# Altium schematic sheet RK3566_VO_SHEET_1.SchDoc
size A4; SheetNumber: 15; SheetTotal: 23
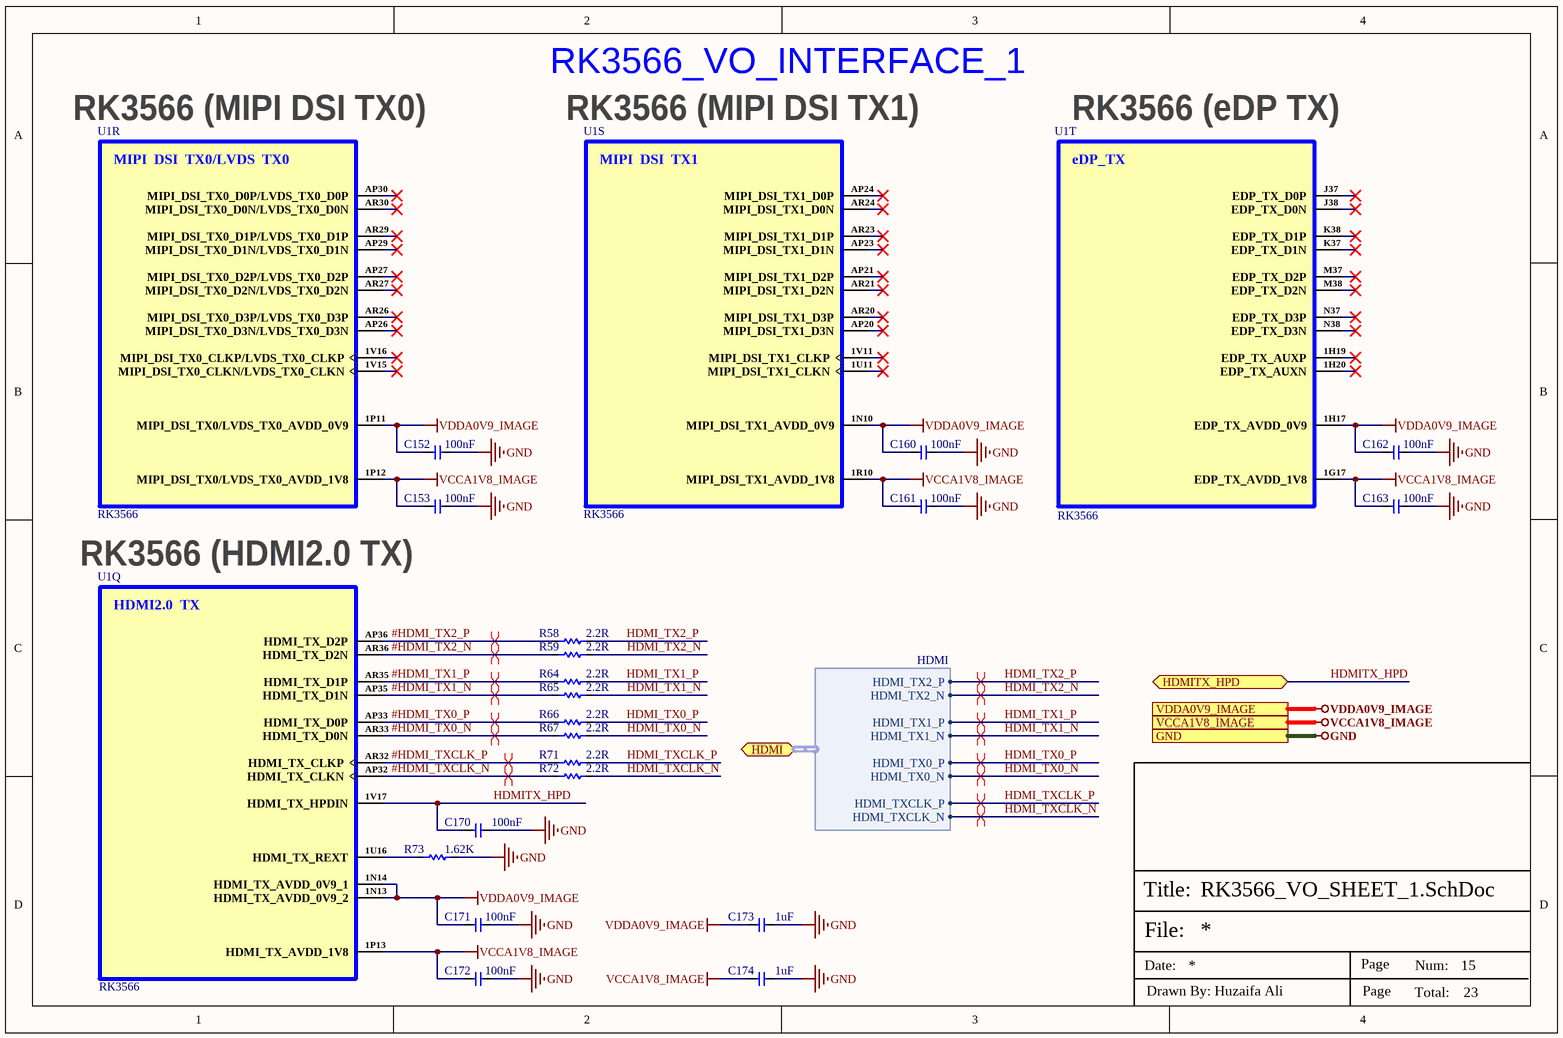
[diagram p0: RK3566_VO_SHEET_1.SchDoc]

## Parts
C152  100nF  [CAP-0201]
C153  100nF  [CAP-0201]
C160  100nF  [CAP-0201]
C161  100nF  [CAP-0201]
C162  100nF  [CAP-0201]
C163  100nF  [CAP-0201]
C170  100nF  [CAP-0201]
C171  100nF  [CAP-0201]
C172  100nF  [CAP-0201]
C173  1uF  [Cap-0402]
C174  1uF  [CAP-0201]
R58  2.2R  [Res-0201]
R59  2.2R  [Res-0201]
R64  2.2R  [Res-0201]
R65  2.2R  [Res-0201]
R66  2.2R  [Res-0201]
R67  2.2R  [Res-0201]
R71  2.2R  [Res-0201]
R72  2.2R  [Res-0201]
R73  1.62K  [Res-0201]
U1  RK3566  [BGA-565(15.5x14.4)]  (parts Q,R,S,T of 22)

## Ports
GND (see DRAM_LPDDR4_SHEET[6D], eMMC_SPI-FLASH_SHEET[1D], HDMI2.0_SHEET[3D], POWER_LDO_SHEET[3D], POWER_OTHER_SHEET[3C], POWER_PMIC_RK809_CODEC[3C], POWER_PMIC_RK809_DC DC[3D], POWER_PMIC_RK809_LDO[4C], POWER_PMIC_RK809_MGM[3D], RK3566_AUDIO_SHEET[3C], RK3566_DDR-PHY_SHEET[5D], RK3566_FLASH-SD_SHEET[4C], RK3566_OSC_PMUIO_SHEET[5D], RK3566_POWER_SHEET[3D], RK3566_SARADC_GPIO[3D], RK3566_USB_PCIe_SHEET[3D], RK3566_VI_SHEET[3D], RK3566_VO_SHEET_2[4C], TYPE-C_INTERFACE_SHEET[3D], TYPE-C_TO_MIPI-CSI_SHEET[5D], USB2.0_SHEET[3D], WIFI-6_SHEET[3D]), HDMI (bidir, harness HDMI, see HDMI2.0_SHEET[2D]), HDMITX_HPD (bidir, see HDMI2.0_SHEET[3D]), VCCA1V8_IMAGE (see POWER_PMIC_RK809_LDO[4C], RK3566_VI_SHEET[3D]), VDDA0V9_IMAGE (see POWER_PMIC_RK809_LDO[4C], RK3566_VI_SHEET[3D])

## Harnesses
HDMI: HDMI_TX2_P, HDMI_TX2_N, HDMI_TX1_P, HDMI_TX1_N, HDMI_TX0_P, HDMI_TX0_N, HDMI_TXCLK_P, HDMI_TXCLK_N

## Nets
GND: C152.1 C153.1 C160.1 C161.1 C162.1 C163.1 C170.1 C171.1 C172.1 C173.1 C174.1 R73.2 ; port GND
VCCA1V8_IMAGE: C153.2 C161.2 C163.2 C172.2 C174.2 U1.1G17(EDP_TX_AVDD_1V8) U1.1P12(MIPI_DSI_TX0/LVDS_TX0_AVDD_1V8) U1.1P13(HDMI_TX_AVDD_1V8) U1.1R10(MIPI_DSI_TX1_AVDD_1V8) ; port VCCA1V8_IMAGE
VDDA0V9_IMAGE: C152.2 C160.2 C162.2 C171.2 C173.2 U1.1H17(EDP_TX_AVDD_0V9) U1.1N10(MIPI_DSI_TX1_AVDD_0V9) U1.1N13(HDMI_TX_AVDD_0V9_2) U1.1N14(HDMI_TX_AVDD_0V9_1) U1.1P11(MIPI_DSI_TX0/LVDS_TX0_AVDD_0V9) ; port VDDA0V9_IMAGE
#HDMI_TX0_N: R67.1 U1.AR33(HDMI_TX_D0N)
#HDMI_TX0_P: R66.1 U1.AP33(HDMI_TX_D0P)
#HDMI_TX1_N: R65.1 U1.AP35(HDMI_TX_D1N)
#HDMI_TX1_P: R64.1 U1.AR35(HDMI_TX_D1P)
#HDMI_TX2_N: R59.1 U1.AR36(HDMI_TX_D2N)
#HDMI_TX2_P: R58.1 U1.AP36(HDMI_TX_D2P)
#HDMI_TXCLK_N: R72.1 U1.AP32(HDMI_TX_CLKN)
#HDMI_TXCLK_P: R71.1 U1.AR32(HDMI_TX_CLKP)
HDMI_TX0_N: R67.2 ; port HDMI.HDMI_TX0_N
HDMI_TX0_P: R66.2 ; port HDMI.HDMI_TX0_P
HDMI_TX1_N: R65.2 ; port HDMI.HDMI_TX1_N
HDMI_TX1_P: R64.2 ; port HDMI.HDMI_TX1_P
HDMI_TX2_N: R59.2 ; port HDMI.HDMI_TX2_N
HDMI_TX2_P: R58.2 ; port HDMI.HDMI_TX2_P
HDMI_TXCLK_N: R72.2 ; port HDMI.HDMI_TXCLK_N
HDMI_TXCLK_P: R71.2 ; port HDMI.HDMI_TXCLK_P
HDMITX_HPD: C170.2 U1.1V17(HDMI_TX_HPDIN) ; port HDMITX_HPD
NetR73_1: R73.1 U1.1U16(HDMI_TX_REXT)

Not connected (* = marked no-connect by the designer): U1 1H19(EDP_TX_AUXP)* 1H20(EDP_TX_AUXN)* 1U11(MIPI_DSI_TX1_CLKN)* 1V11(MIPI_DSI_TX1_CLKP)* 1V15(MIPI_DSI_TX0_CLKN/LVDS_TX0_CLKN)* 1V16(MIPI_DSI_TX0_CLKP/LVDS_TX0_CLKP)* AP20(MIPI_DSI_TX1_D3N)* AP21(MIPI_DSI_TX1_D2P)* AP23(MIPI_DSI_TX1_D1N)* AP24(MIPI_DSI_TX1_D0P)* AP26(MIPI_DSI_TX0_D3N/LVDS_TX0_D3N)* AP27(MIPI_DSI_TX0_D2P/LVDS_TX0_D2P)* AP29(MIPI_DSI_TX0_D1N/LVDS_TX0_D1N)* AP30(MIPI_DSI_TX0_D0P/LVDS_TX0_D0P)* AR20(MIPI_DSI_TX1_D3P)* AR21(MIPI_DSI_TX1_D2N)* AR23(MIPI_DSI_TX1_D1P)* AR24(MIPI_DSI_TX1_D0N)* AR26(MIPI_DSI_TX0_D3P/LVDS_TX0_D3P)* AR27(MIPI_DSI_TX0_D2N/LVDS_TX0_D2N)* AR29(MIPI_DSI_TX0_D1P/LVDS_TX0_D1P)* AR30(MIPI_DSI_TX0_D0N/LVDS_TX0_D0N)* J37(EDP_TX_D0P)* J38(EDP_TX_D0N)* K37(EDP_TX_D1N)* K38(EDP_TX_D1P)* M37(EDP_TX_D2P)* M38(EDP_TX_D2N)* N37(EDP_TX_D3P)* N38(EDP_TX_D3N)*

## Layout directives
differential pair; differential pair class HDMI_100R: #HDMI_TX0_N, #HDMI_TX0_P, #HDMI_TX1_N, #HDMI_TX1_P, #HDMI_TX2_N, #HDMI_TX2_P, #HDMI_TXCLK_N, #HDMI_TXCLK_P, HDMI_TX0_N, HDMI_TX0_P, HDMI_TX1_N, HDMI_TX1_P, HDMI_TX2_N, HDMI_TX2_P, HDMI_TXCLK_N, HDMI_TXCLK_P

## Notes on the sheet
- RK3566 (MIPI DSI TX0)
- RK3566 (MIPI DSI TX1)
- RK3566_VO_INTERFACE_1
- RK3566 (eDP TX)
- (near C153) RK3566 (HDMI2.0 TX)
- File:
- Title:
- Date:
- Page
- Num:
- Total:
- Drawn By: Huzaifa Ali
- (in symbol RK3566, part Q) HDMI2.0  TX
- (in symbol RK3566, part R) MIPI  DSI  TX0/LVDS  TX0
- (in symbol RK3566, part S) MIPI  DSI  TX1
- (in symbol RK3566, part T) eDP_TX

## Library data of the parts
C152 C153 C160-C163 C170-C172 = CC0201KRX5R6BB104: CAP CER 0.1UF 10V X5R 0201; Manufacturer: Yageo; Tolerance: 10%; Supplier 1: Mouser; Manufacturer Part Number: CC0201KRX5R6BB104; RoHS: Yes; Category: Ceramic Capacitors; Stock 1: 824403; Pricing 1: 1=0.10000, 10=0.02400, 50=0.02400, 100=0.01900, 1000=0.01100, 10000=0.00900 (USD); Mount: Surface Mount; Case/Package: 0201; Case Code (Imperial): 0201; Case Code (Metric): 0603; Weight: 6E-06oz; Min Operating Temperature: -55°C; Max Operating Temperature: 85°C; Capacitance: 100nF; Dielectric: X5R; Voltage Rating (DC): 10V; Packaging: Tape and Reel; Termination: SMD/SMT; Resistor Type: Ceramic; Voltage Rating: 10V; Series: CC; Construction: Flat; Length: 0.6mm; Width: 0.012inch; Height: 0.3mm; Thickness: 0.013inch; Depth: 0.3mm; Radiation Hardening: No; Lead Free: Lead Free; Halogen Free: Halogen Free; RoHS Compliant: Yes; ComponentLink1URL: https://datasheet.ciiva.com/11587/upy-gphc-x5r-4v-to-50v-12-11587190.pdf?src-supplier=Avnet; ComponentLink1Description: https://datasheet.ciiva.com/11587/upy-gphc-x5r-4v-to-50v-12-11587190.pdf?src-supplier=Avnet; Supplier Part Number 1: 603-CC201KRX5R6BB104; LCSC Part Number: C190183
C173 = CC0402KRX5R6BB105: CAP CER 1UF 10V X5R 0402; Manufacturer: Yageo; Item Type: Capacitor; Tolerance: 10%; Dissipation Factor: 15%; Manufacturer Part Number: CC0402KRX5R6BB105; RoHS: Yes; Category: Ceramic Capacitors; ComponentLink1URL: https://datasheet.ciiva.com/176/upy-gphc-x5r-4v-to-50v-12-176704.pdf?src-supplier=Digi-Key; ComponentLink1Description: https://datasheet.ciiva.com/176/upy-gphc-x5r-4v-to-50v-12-176704.pdf?src-supplier=Digi-Key; ComponentLink2URL: https://datasheet.ciiva.com/176/mlccorderingcode-176705.pdf?src-supplier=Digi-Key; ComponentLink2Description: https://datasheet.ciiva.com/176/mlccorderingcode-176705.pdf?src-supplier=Digi-Key; LCSC Part Number: C106254; ComponentLink3URL: https://datasheet.ciiva.com/176/mlccorderingcode-176706.pdf?src-supplier=Digi-Key; ComponentLink3Description: https://datasheet.ciiva.com/176/mlccorderingcode-176706.pdf?src-supplier=Digi-Key; Supplier 1: Mouser; Stock 1: 6711367; Pricing 1: 1=0.11000, 10=0.05500, 50=0.05500, 100=0.03300, 500=0.02700, 1000=0.02200, 2500=0.02100, 10000=0.01800 (USD); Mount: Surface Mount; Case/Package: 0402; Number of Pins: 2; Case Code (Metric): 1005; Case Code (Imperial): 0402; Min Operating Temperature: -55°C; Max Operating Temperature: 85°C; Capacitance: 1uF; Dielectric: X5R; Package Quantity: 1; Voltage Rating: 10V; Packaging: Tape and Reel; Voltage Rating (DC): 10V; Termination: SMD/SMT; Resistor Type: Ceramic; Series: CC; Construction: Flat; Length: 1mm; Width: 0.02inch; Height: 0.5mm; Thickness: 0.022inch; Depth: 0.5mm; Radiation Hardening: No; REACH SVHC: No SVHC; Lead Free: Lead Free; Halogen Free: Halogen Free; RoHS Compliant: Yes; Supplier Part Number 1: 603-CC402KRX5R6BB105
C174 = CC0201MRX5R6BB105: CAP CER 1UF 10V X5R 0201; Manufacturer: Yageo; Item Type: Capacitor; Manufacturer Part Number: CC0201MRX5R6BB105; RoHS: Yes; Category: Ceramic Capacitors; ComponentLink1URL: https://datasheet.octopart.com/CC0201MRX5R6BB105-Yageo-datasheet-158238148.pdf?src-supplier=Farnell; ComponentLink1Description: https://datasheet.octopart.com/CC0201MRX5R6BB105-Yageo-datasheet-158238148.pdf?src-supplier=Farnell; ComponentLink2URL: http://www.yageo.com/documents/recent/UPY-GPHC_X5R_4V-to-50V_25.pdf?src-supplier=Digi-Key; ComponentLink2Description: http://www.yageo.com/documents/recent/UPY-GPHC_X5R_4V-to-50V_25.pdf?src-supplier=Digi-Key; LCSC Part Number: C605210; Supplier: Digi-Key; Supplier Part Number: 311-3474-1-ND; Stock: 772400; Pricing: 1=0.19, 10=0.135, 50=0.0764, 100=0.0633, 500=0.04436, 1000=0.03672, 2500=0.03418, 5000=0.03127 (USD); ComponentLink3URL: https://datasheet.octopart.com/CC0201MRX5R6BB105-Yageo-datasheet-137700082.pdf?src-supplier=Future+Electronics; ComponentLink3Description: https://datasheet.octopart.com/CC0201MRX5R6BB105-Yageo-datasheet-137700082.pdf?src-supplier=Future+Electronics
R58 R59 R64-R67 R71 R72 = 0201WMF220KTEE: 50mW Thick Film Resistors 25V ±1% -100ppm/℃~+350ppm/℃ 2.2Ω 0201 Chip Resistor - Surface Mount ROHS; Manufacturer: UNI-ROYAL; Manufacturer Part Number: 0201WMF220KTEE; ComponentLink1URL: https://www.lcsc.com/product-detail/Chip-Resistor-Surface-Mount_UNI-ROYAL-Uniroyal-Elec-0201WMF220KTEE_C473517.html; ComponentLink1Description: LCSC; LCSC Part Number: C473517; Package: 0201; Item Type: Resistor
R73 = RC0201DR-071K62L: RES 1.62K OHM 0.5% 1/20W 0201; Manufacturer: Yageo; Value: 1.62kR; Max Power Dissipation: 50mW; Temperature Coefficient: 200ppm/°C; Item Type: Resistor; Supplier: Avnet; Supplier Part Number: RC0201DR-071K62L; Manufacturer Part Number: RC0201DR-071K62L; RoHS: Yes; Category: Chip SMD Resistors; Pricing: 10000=0.01131 (USD); Case/Package: 0201; Min Operating Temperature: -55°C; Max Operating Temperature: 125°C; Packaging: Tape and Reel; Number of Terminations: 2; Tolerance: 0.5%; Features: Moisture Resistant; Series: RC; Length: 0.024inch; Width: 0.012inch; Height: 0.01inch; RoHS Compliant: Yes; ComponentLink1URL: http://www.yageo.com.tw/exep/pages/download/literatures/PYu-R_INT-thick_7.pdf?src-supplier=Digikey; ComponentLink1Description: http://www.yageo.com.tw/exep/pages/download/literatures/PYu-R_INT-thick_7.pdf?src-supplier=Digikey; LCSC Part Number: C851673
U1 = RK3566: BGA-565(15.5x14.4) Microcontrollers (MCU/MPU/SOC) ROHS; Manufacturer: Rockchip; Item Type: IC; Manufacturer Part Number: RK3566; Package: BGA-565(15.5x14.4); LCSC Part Number: C2943786; ComponentLink1Description: LCSC; ComponentLink1URL: https://www.lcsc.com/product-detail/Microcontrollers-MCU-MPU-SOC_Rockchip-RK3566_C2943786.html